# Altium schematic sheet POE.SchDoc
size A4; SheetNumber: 12; SheetTotal: 16
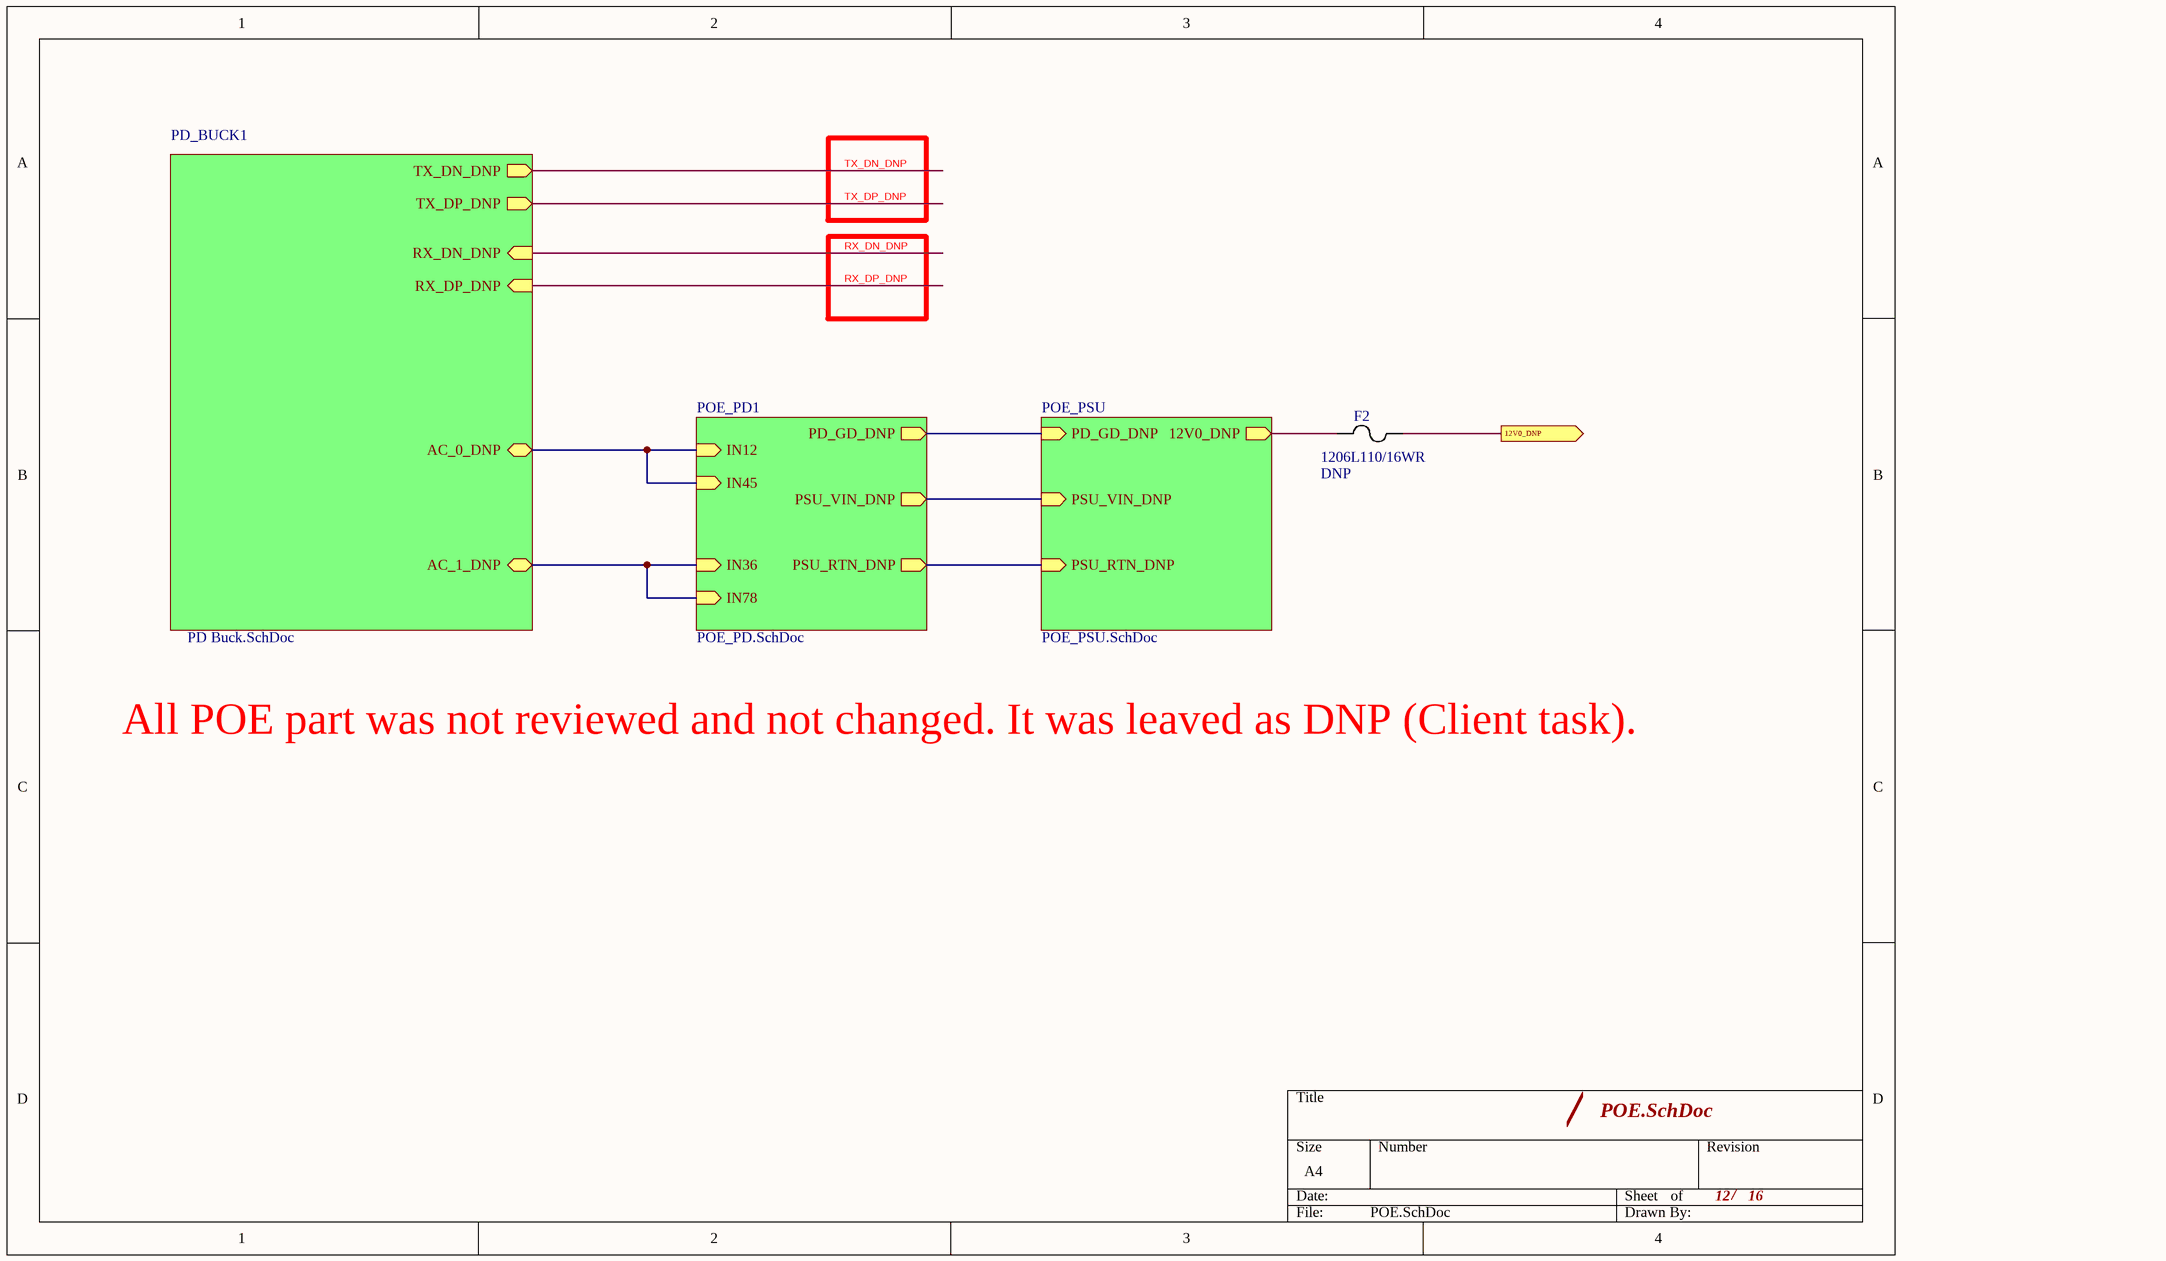
[diagram p0: POE.SchDoc]

## Parts
F2  1206L110/16WR  PMNT: DNP  [1206LSeries_LTF]

## Sub-sheets
PD_BUCK1 = PD Buck.SchDoc: AC_0_DNP (bidir), AC_1_DNP (bidir), RX_DP_DNP (in), RX_DN_DNP (in), TX_DN_DNP (out), TX_DP_DNP (out)
POE_PD1 = POE_PD.SchDoc: IN12 (in), IN36 (in), PD_GD_DNP (out), PSU_VIN_DNP (out), PSU_RTN_DNP (out), IN78 (in), IN45 (in)
POE_PSU = POE_PSU.SchDoc: PSU_RTN_DNP (in), PD_GD_DNP (in), PSU_VIN_DNP (in), 12V0_DNP (out)

## Ports
12V0_DNP (out)

## Nets
12V0_DNP: F2.2 ; port 12V0_DNP
RX_DN_DNP: sheet PD_BUCK1/RX_DN_DNP
RX_DP_DNP: sheet PD_BUCK1/RX_DP_DNP
TX_DN_DNP: sheet PD_BUCK1/TX_DN_DNP
TX_DP_DNP: sheet PD_BUCK1/TX_DP_DNP
NetF2_1: F2.1 ; sheet POE_PSU/12V0_DNP
(unnamed): sheet POE_PSU/PSU_RTN_DNP, sheet POE_PD1/PSU_RTN_DNP
(unnamed): sheet POE_PSU/PD_GD_DNP, sheet POE_PD1/PD_GD_DNP
(unnamed): sheet POE_PSU/PSU_VIN_DNP, sheet POE_PD1/PSU_VIN_DNP
(unnamed): sheet POE_PD1/IN12, sheet POE_PD1/IN45, sheet PD_BUCK1/AC_0_DNP
(unnamed): sheet POE_PD1/IN36, sheet POE_PD1/IN78, sheet PD_BUCK1/AC_1_DNP

## Notes on the sheet
- All POE part was not reviewed and not changed. It was leaved as DNP (Client task).
- /

## Library data of the parts
F2 = 1206L05015YR: PTC RESET FUSE 16V 1.1A 1206; Mfr_Name: Littelfuse Inc; Current - Trip (It): 2.2 A; Resistance - Initial (Ri) (Min): 40 mOhms; Voltage - Max: 16 V; MPN: 1206L110/16WR; Current - Hold (Ih) (Max): 1.1 A; ComponentLink1Description: DigiKey; ComponentLink1URL: https://www.digikey.com/en/products/detail/littelfuse-inc/1206L110-16WR/3997167?s=N4IgTCBcDaIIxgAwDYAyc6IPR2SAugL5A